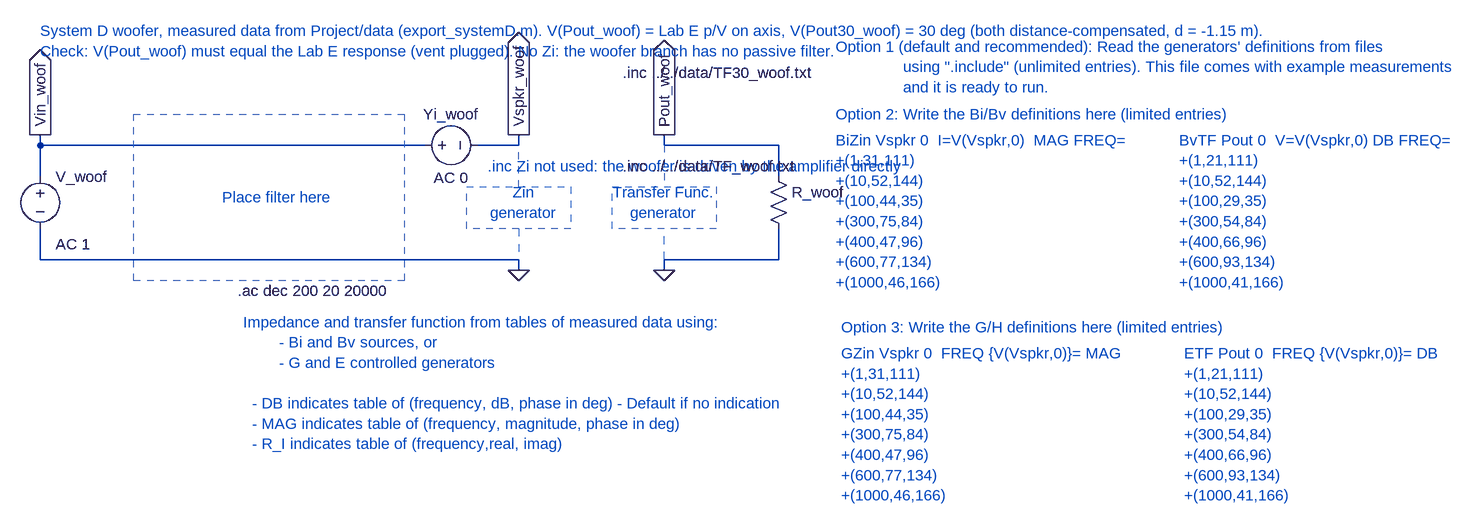
[diagram p0: schematic Unit_woof.asc]
Unit_woof.asc, the LTspice schematic file:
Version 4
SHEET 1 52524 976
WIRE -224 80 -224 64
WIRE 368 80 -224 80
WIRE 512 80 512 64
WIRE 512 80 448 80
WIRE 736 80 736 64
WIRE 912 80 736 80
WIRE -224 128 -224 80
WIRE 912 128 912 80
WIRE -224 256 -224 208
WIRE 512 256 -224 256
WIRE 912 256 912 208
WIRE 912 256 736 256
WIRE 512 272 512 256
WIRE 736 272 736 256
FLAG 512 272 0
FLAG -224 64 Vin_woof
IOPIN -224 64 Out
FLAG 736 272 0
FLAG 512 64 Vspkr_woof
IOPIN 512 64 Out
FLAG 736 64 Pout_woof
IOPIN 736 64 Out
SYMBOL voltage -224 112 R0
WINDOW 123 24 120 Left 2
WINDOW 39 0 0 Left 0
SYMATTR Value2 AC 1
SYMATTR InstName V_woof
SYMATTR Value ""
SYMBOL res 896 112 R0
WINDOW 3 36 76 Invisible 2
SYMATTR Value 1k
SYMATTR InstName R_woof
SYMBOL voltage 352 80 R270
WINDOW 0 32 56 VTop 2
WINDOW 3 -32 56 VBottom 2
WINDOW 123 -34 56 VBottom 2
WINDOW 39 0 0 Left 0
SYMATTR InstName Yi_woof
SYMATTR Value ""
SYMATTR Value2 AC 0
TEXT 80 304 Left 2 !.ac dec 200 20 20000
TEXT 88 352 Left 2 ;Impedance and transfer function from tables of measured data using:\n        - Bi and Bv sources, or \n        - G and E controlled generators\n \n  - DB indicates table of (frequency, dB, phase in deg) - Default if no indication\n  - MAG indicates table of (frequency, magnitude, phase in deg)\n  - R_I indicates table of (frequency,real, imag)
TEXT 1000 72 Left 2 ;BiZin Vspkr 0  I=V(Vspkr,0)  MAG FREQ= \n+(1,31,111)\n+(10,52,144)\n+(100,44,35)\n+(300,75,84)\n+(400,47,96)\n+(600,77,134)\n+(1000,46,166)
TEXT 1528 72 Left 2 ;BvTF Pout 0  V=V(Vspkr,0) DB FREQ=  \n+(1,21,111)\n+(10,52,144)\n+(100,29,35)\n+(300,54,84)\n+(400,66,96)\n+(600,93,134)\n+(1000,41,166)
TEXT 1008 400 Left 2 ;GZin Vspkr 0  FREQ {V(Vspkr,0)}= MAG\n+(1,31,111)\n+(10,52,144)\n+(100,44,35)\n+(300,75,84)\n+(400,47,96)\n+(600,77,134)\n+(1000,46,166)
TEXT 1536 400 Left 2 ;ETF Pout 0  FREQ {V(Vspkr,0)}= DB\n+(1,21,111)\n+(10,52,144)\n+(100,29,35)\n+(300,54,84)\n+(400,66,96)\n+(600,93,134)\n+(1000,41,166)
TEXT 464 112 Left 2 ;.inc Zi not used: the woofer is driven by the amplifier directly
TEXT 672 112 Left 2 !.inc ../../data/TF_woof.txt
TEXT 1000 -72 Left 2 ;Option 1 (default and recommended): Read the generators' definitions from files\n               using ".include" (unlimited entries). This file comes with example measurements\n               and it is ready to run.
TEXT 1000 32 Left 2 ;Option 2: Write the Bi/Bv definitions here (limited entries)
TEXT 1008 360 Left 2 ;Option 3: Write the G/H definitions here (limited entries)
TEXT 520 168 Center 2 ;Zin\ngenerator
TEXT 736 168 Center 2 ;Transfer Func.\ngenerator
TEXT 56 160 Left 2 ;Place filter here
LINE Normal 736 80 736 144 2
LINE Normal 736 256 736 208 2
LINE Normal 512 208 512 256 2
LINE Normal 512 144 512 80 2
RECTANGLE Normal 816 208 656 144 2
RECTANGLE Normal 592 208 432 144 2
RECTANGLE Normal 336 288 -80 32 2
TEXT 672 -32 Left 2 !.inc ../../data/TF30_woof.txt
TEXT -224 -96 Left 2 ;System D woofer, measured data from Project/data (export_systemD.m). V(Pout_woof) = Lab E p/V on axis, V(Pout30_woof) = 30 deg (both distance-compensated, d = -1.15 m).\nCheck: V(Pout_woof) must equal the Lab E response (vent plugged). No Zi: the woofer branch has no passive filter.

The netlist it stands for:
* Unit_woof.asc
V_woof Vin_woof 0 AC 1
R_woof Pout_woof 0 1k
V§Yi_woof Vin_woof Vspkr_woof AC 0
.ac dec 200 20 20000
* Impedance and transfer function from tables of measured data using:
*         - Bi and Bv sources, or
*         - G and E controlled generators
*   - DB indicates table of (frequency, dB, phase in deg) - Default if no indication
*   - MAG indicates table of (frequency, magnitude, phase in deg)
*   - R_I indicates table of (frequency,real, imag)
* BiZin Vspkr 0  I=V(Vspkr,0)  MAG FREQ=
* +(1,31,111)
* +(10,52,144)
* +(100,44,35)
* +(300,75,84)
* +(400,47,96)
* +(600,77,134)
* +(1000,46,166)
* BvTF Pout 0  V=V(Vspkr,0) DB FREQ=
* +(1,21,111)
* +(10,52,144)
* +(100,29,35)
* +(300,54,84)
* +(400,66,96)
* +(600,93,134)
* +(1000,41,166)
* GZin Vspkr 0  FREQ {V(Vspkr,0)}= MAG
* +(1,31,111)
* +(10,52,144)
* +(100,44,35)
* +(300,75,84)
* +(400,47,96)
* +(600,77,134)
* +(1000,46,166)
* ETF Pout 0  FREQ {V(Vspkr,0)}= DB
* +(1,21,111)
* +(10,52,144)
* +(100,29,35)
* +(300,54,84)
* +(400,66,96)
* +(600,93,134)
* +(1000,41,166)
* .inc Zi not used: the woofer is driven by the amplifier directly
.inc ../../data/TF_woof.txt
* Option 1 (default and recommended): Read the generators' definitions from files
*                using ".include" (unlimited entries). This file comes with example measurements
*                and it is ready to run.
* Option 2: Write the Bi/Bv definitions here (limited entries)
* Option 3: Write the G/H definitions here (limited entries)
* Zin
* generator
* Transfer Func.
* generator
* Place filter here
.inc ../../data/TF30_woof.txt
* System D woofer, measured data from Project/data (export_systemD.m). V(Pout_woof) = Lab E p/V on axis, V(Pout30_woof) = 30 deg (both distance-compensated, d = -1.15 m).
* Check: V(Pout_woof) must equal the Lab E response (vent plugged). No Zi: the woofer branch has no passive filter.
.backanno
.end